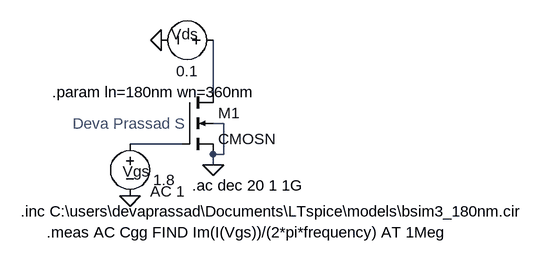
[diagram p0: schematic Cgg.asc]
Cgg.asc, the LTspice schematic file:
Version 4.1
SHEET 1 880 680
WIRE 176 128 176 48
WIRE 192 176 176 176
WIRE 128 208 48 208
WIRE 192 224 192 176
WIRE 192 224 176 224
WIRE 176 240 176 224
FLAG 176 240 0
FLAG 96 48 0
FLAG 48 288 0
SYMBOL nmos4 128 128 R0
SYMATTR InstName M1
SYMATTR Value2 l={ln} w={wn}
SYMATTR Value CMOSN
SYMBOL voltage 192 48 R90
WINDOW 0 6 60 VBottom 2
WINDOW 3 32 56 VTop 2
WINDOW 123 0 0 Left 0
WINDOW 39 0 0 Left 0
SYMATTR InstName Vds
SYMATTR Value 0.1
SYMBOL voltage 48 192 R0
WINDOW 0 -11 58 Left 2
WINDOW 3 36 71 Left 2
WINDOW 123 31 89 Left 2
WINDOW 39 0 0 Left 0
SYMATTR InstName Vgs
SYMATTR Value 1.8
SYMATTR Value2 AC 1
TEXT -120 312 Left 2 !.inc C:\\users\\devaprassad\\Documents\\LTspice\\models\\bsim3_180nm.cir
TEXT -72 128 Left 2 !.param ln=180nm wn=360nm
TEXT 144 272 Left 2 !.ac dec 20 1 1G
TEXT -80 344 Left 2 !.meas AC Cgg FIND Im(I(Vgs))/(2*pi*frequency) AT 1Meg
TEXT -40 176 Left 2 ;Deva Prassad S

The netlist it stands for:
* Cgg.asc
M1 N001 N002 0 0 CMOSN l={ln} w={wn}
Vds N001 0 0.1
Vgs N002 0 1.8 AC 1
.model NMOS NMOS
.model PMOS PMOS
.lib standard.mos
.inc C:\users\devaprassad\Documents\LTspice\models\bsim3_180nm.cir
.param ln=180nm wn=360nm
.ac dec 20 1 1G
.meas AC Cgg FIND Im(I(Vgs))/(2*pi*frequency) AT 1Meg
* Deva Prassad S
.backanno
.end